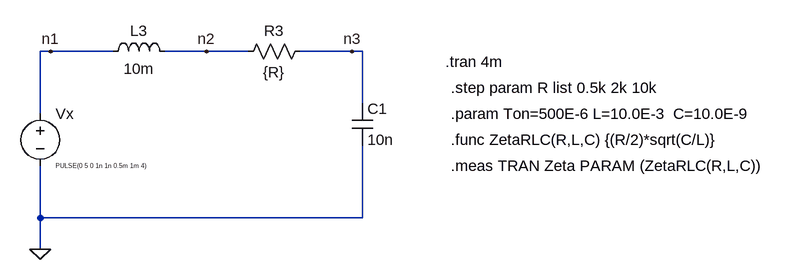
[diagram p0: schematic exp5 C.asc]
exp5 C.asc, the LTspice schematic file:
Version 4
SHEET 1 1128 680
WIRE 0 0 -16 0
WIRE 96 0 0 0
WIRE 240 0 176 0
WIRE 304 0 240 0
WIRE 464 0 384 0
WIRE 480 0 464 0
WIRE 480 80 480 0
WIRE -16 96 -16 0
WIRE -16 256 -16 176
WIRE 480 256 480 144
WIRE 480 256 -16 256
WIRE -16 304 -16 256
FLAG -16 304 0
FLAG 0 0 n1
FLAG 464 0 n3
FLAG 240 0 n2
SYMBOL res 400 -16 R90
WINDOW 0 0 56 VBottom 2
WINDOW 3 32 56 VTop 2
SYMATTR InstName R3
SYMATTR Value {R}
SYMBOL voltage -16 80 R0
WINDOW 3 24 96 Left 0
WINDOW 123 0 0 Left 0
WINDOW 39 0 0 Left 0
SYMATTR Value PULSE(0 5 0 1n 1n 0.5m 1m 4)
SYMATTR InstName Vx
SYMBOL cap 464 80 R0
SYMATTR InstName C1
SYMATTR Value 10n
SYMBOL ind 80 16 R270
WINDOW 0 32 56 VTop 2
WINDOW 3 5 56 VBottom 2
SYMATTR InstName L3
SYMATTR Value 10m
TEXT 608 16 Left 2 !.tran 4m
TEXT 616 56 Left 2 !.step param R list 0.5k 2k 10k
TEXT 616 96 Left 2 !.param Ton=500E-6 L=10.0E-3  C=10.0E-9
TEXT 616 136 Left 2 !.func ZetaRLC(R,L,C) {(R/2)*sqrt(C/L)}
TEXT 616 176 Left 2 !.meas TRAN Zeta PARAM (ZetaRLC(R,L,C))

The netlist it stands for:
* exp5 C.asc
R3 n3 n2 {R}
Vx n1 0 PULSE(0 5 0 1n 1n 0.5m 1m 4)
C1 n3 0 10n
L3 n1 n2 10m
.tran 4m
.step param R list 0.5k 2k 10k
.param Ton=500E-6 L=10.0E-3  C=10.0E-9
.func ZetaRLC(R,L,C) {(R/2)*sqrt(C/L)}
.meas TRAN Zeta PARAM (ZetaRLC(R,L,C))
.backanno
.end